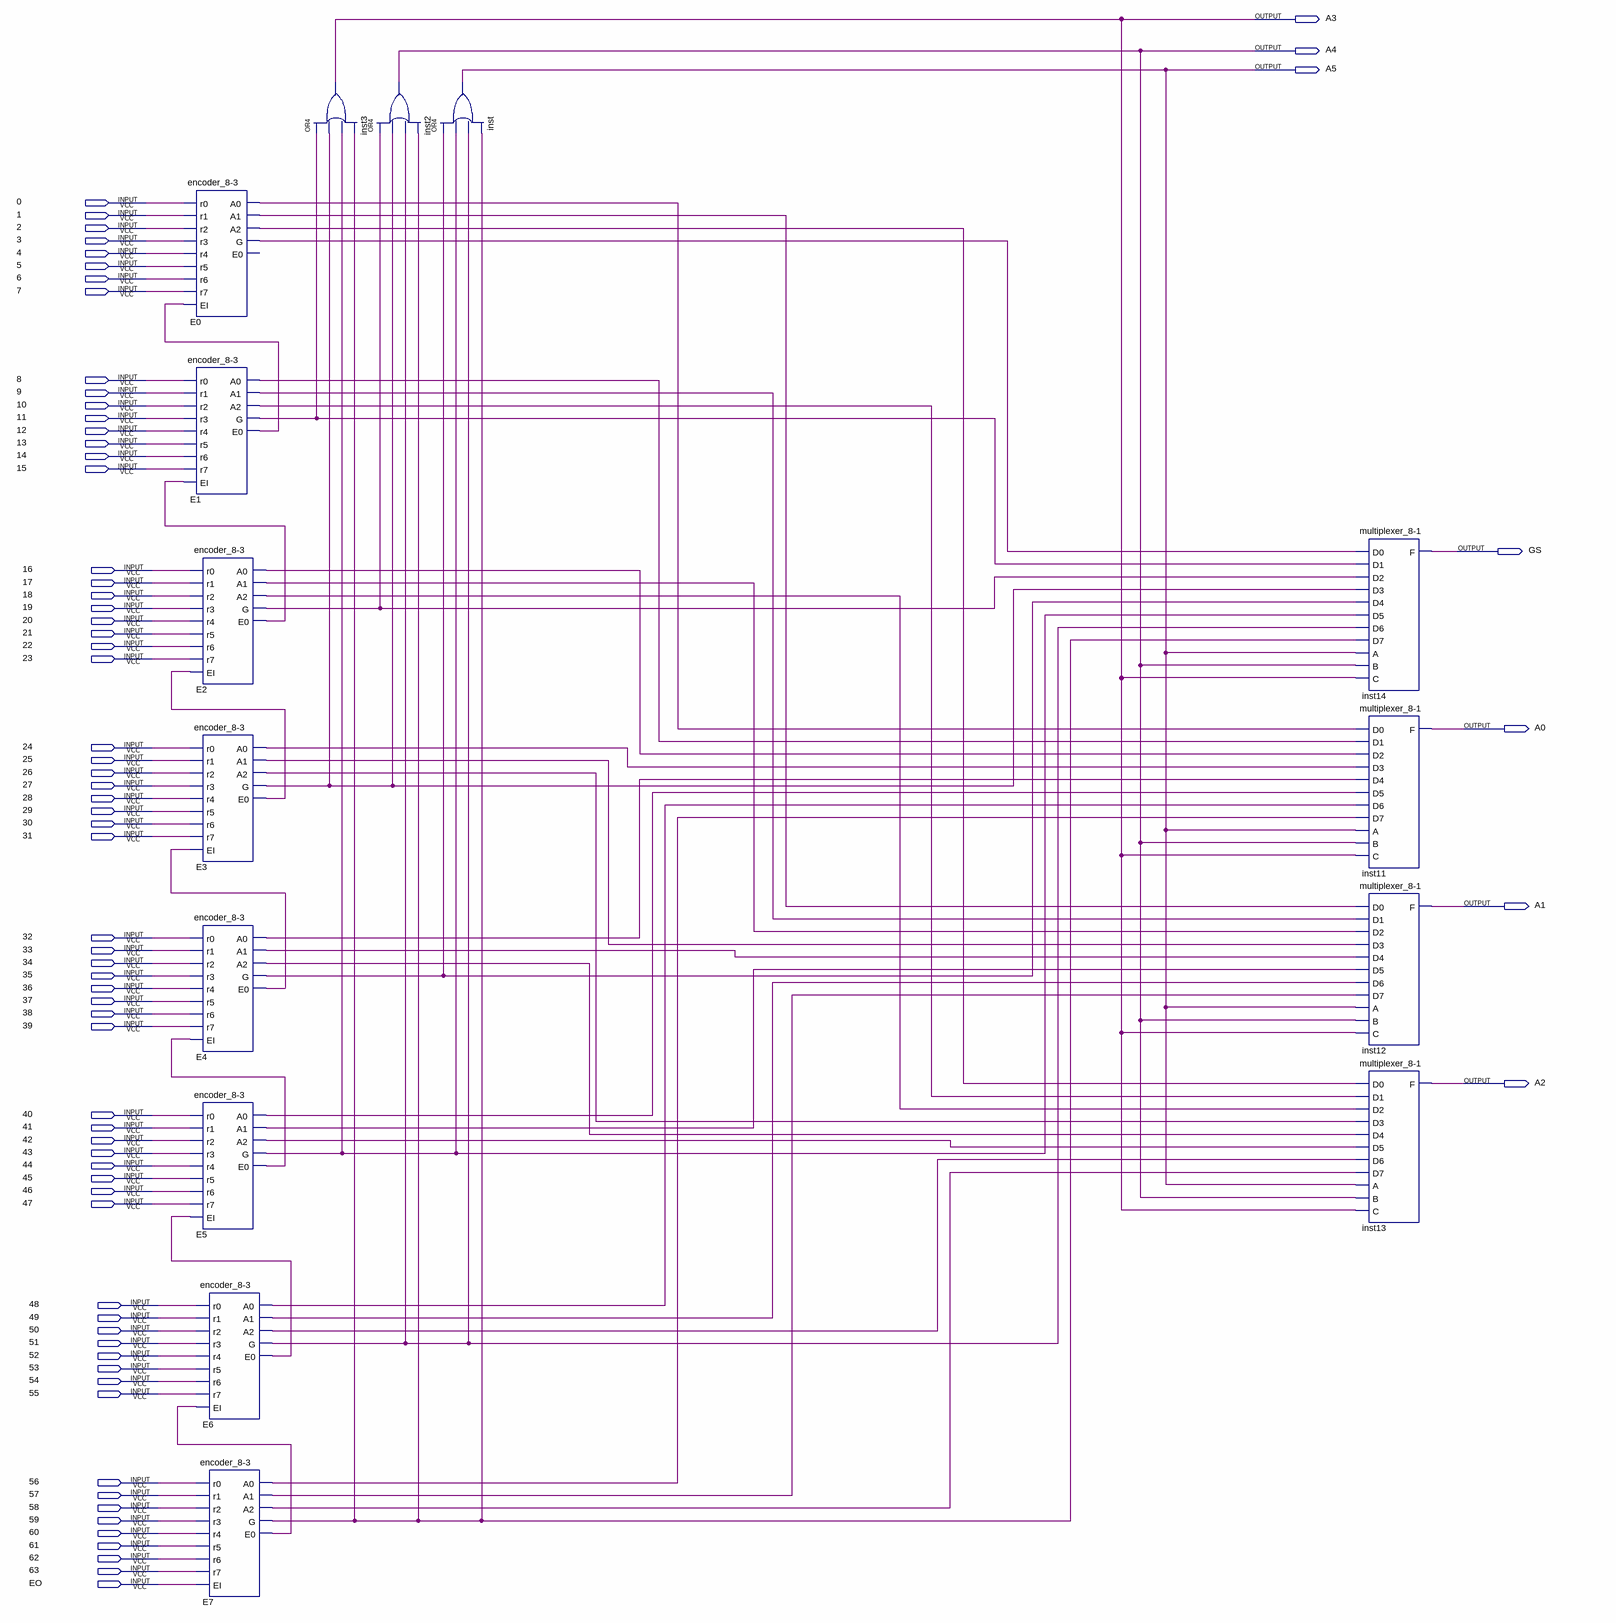
[diagram p0: schematic sheet]
// Quartus schematic encoder_64-6.bdf as structural Verilog: 15 symbols, 72 pins
module \encoder_64-6  (
  input  \0 ,
  input  \1 ,
  input  \2 ,
  input  \3 ,
  input  \4 ,
  input  \5 ,
  input  \6 ,
  input  \7 ,
  input  \8 ,
  input  \9 ,
  input  \10 ,
  input  \11 ,
  input  \12 ,
  input  \13 ,
  input  \14 ,
  input  \15 ,
  input  \16 ,
  input  \17 ,
  input  \18 ,
  input  \19 ,
  input  \20 ,
  input  \21 ,
  input  \22 ,
  input  \23 ,
  input  \24 ,
  input  \25 ,
  input  \26 ,
  input  \27 ,
  input  \28 ,
  input  \29 ,
  input  \30 ,
  input  \31 ,
  input  \32 ,
  input  \33 ,
  input  \34 ,
  input  \35 ,
  input  \36 ,
  input  \37 ,
  input  \38 ,
  input  \39 ,
  input  \40 ,
  input  \41 ,
  input  \42 ,
  input  \43 ,
  input  \44 ,
  input  \45 ,
  input  \46 ,
  input  \47 ,
  input  \48 ,
  input  \49 ,
  input  \50 ,
  input  \51 ,
  input  \52 ,
  input  \53 ,
  input  \54 ,
  input  \55 ,
  input  \56 ,
  input  \57 ,
  input  \58 ,
  input  \59 ,
  input  \60 ,
  input  \61 ,
  input  \62 ,
  input  \63 ,
  input  EO,
  output A3,
  output A4,
  output A5,
  output GS,
  output A0,
  output A1,
  output A2
);

  wire E0_a0, E0_a1, E0_a2, E0_g, E1_a0, E1_a1, E1_a2, E1_e0, E1_g, E2_a0, E2_a1, E2_a2, E2_e0, E2_g, E3_a0,
       E3_a1, E3_a2, E3_e0, E3_g, E4_a0, E4_a1, E4_a2, E4_e0, E4_g, E5_a0, E5_a1, E5_a2, E5_e0, E5_g, E6_a0,
       E6_a1, E6_a2, E6_e0, E6_g, E7_a0, E7_a1, E7_a2, E7_e0, E7_g;

  \encoder_8-3  E0 (
    .r0(\0 ), .r1(\1 ), .r2(\2 ), .r3(\3 ), .r4(\4 ), .r5(\5 ), .r6(\6 ), .r7(\7 ), .EI(E1_e0), .A0(E0_a0),
    .A1(E0_a1), .A2(E0_a2), .G(E0_g));  // open: E0
  \encoder_8-3  E1 (
    .r0(\8 ), .r1(\9 ), .r2(\10 ), .r3(\11 ), .r4(\12 ), .r5(\13 ), .r6(\14 ), .r7(\15 ), .EI(E2_e0),
    .A0(E1_a0), .A1(E1_a1), .A2(E1_a2), .G(E1_g), .E0(E1_e0));
  \encoder_8-3  E2 (
    .r0(\16 ), .r1(\17 ), .r2(\18 ), .r3(\19 ), .r4(\20 ), .r5(\21 ), .r6(\22 ), .r7(\23 ), .EI(E3_e0),
    .A0(E2_a0), .A1(E2_a1), .A2(E2_a2), .G(E2_g), .E0(E2_e0));
  \encoder_8-3  E3 (
    .r0(\24 ), .r1(\25 ), .r2(\26 ), .r3(\27 ), .r4(\28 ), .r5(\29 ), .r6(\30 ), .r7(\31 ), .EI(E4_e0),
    .A0(E3_a0), .A1(E3_a1), .A2(E3_a2), .G(E3_g), .E0(E3_e0));
  \encoder_8-3  E4 (
    .r0(\32 ), .r1(\33 ), .r2(\34 ), .r3(\35 ), .r4(\36 ), .r5(\37 ), .r6(\38 ), .r7(\39 ), .EI(E5_e0),
    .A0(E4_a0), .A1(E4_a1), .A2(E4_a2), .G(E4_g), .E0(E4_e0));
  \encoder_8-3  E5 (
    .r0(\40 ), .r1(\41 ), .r2(\42 ), .r3(\43 ), .r4(\44 ), .r5(\45 ), .r6(\46 ), .r7(\47 ), .EI(E6_e0),
    .A0(E5_a0), .A1(E5_a1), .A2(E5_a2), .G(E5_g), .E0(E5_e0));
  \encoder_8-3  E6 (
    .r0(\48 ), .r1(\49 ), .r2(\50 ), .r3(\51 ), .r4(\52 ), .r5(\53 ), .r6(\54 ), .r7(\55 ), .EI(E7_e0),
    .A0(E6_a0), .A1(E6_a1), .A2(E6_a2), .G(E6_g), .E0(E6_e0));
  \encoder_8-3  E7 (
    .r0(\56 ), .r1(\57 ), .r2(\58 ), .r3(\59 ), .r4(\60 ), .r5(\61 ), .r6(\62 ), .r7(\63 ), .EI(EO),
    .A0(E7_a0), .A1(E7_a1), .A2(E7_a2), .G(E7_g), .E0(E7_e0));
  or inst3 (A3, E1_g, E3_g, E5_g, E7_g);
  or inst2 (A4, E2_g, E3_g, E6_g, E7_g);
  or inst (A5, E4_g, E5_g, E6_g, E7_g);
  \multiplexer_8-1  inst14 (
    .D0(E0_g), .D1(E1_g), .D2(E2_g), .D3(E3_g), .D4(E4_g), .D5(E5_g), .D6(E6_g), .D7(E7_g), .A(A5), .B(A4),
    .C(A3), .F(GS));
  \multiplexer_8-1  inst11 (
    .D0(E0_a0), .D1(E1_a0), .D2(E2_a0), .D3(E3_a0), .D4(E4_a0), .D5(E5_a0), .D6(E6_a0), .D7(E7_a0), .A(A5),
    .B(A4), .C(A3), .F(A0));
  \multiplexer_8-1  inst12 (
    .D0(E0_a1), .D1(E1_a1), .D2(E2_a1), .D3(E3_a1), .D4(E4_a1), .D5(E5_a1), .D6(E6_a1), .D7(E7_a1), .A(A5),
    .B(A4), .C(A3), .F(A1));
  \multiplexer_8-1  inst13 (
    .D0(E0_a2), .D1(E1_a2), .D2(E2_a2), .D3(E3_a2), .D4(E4_a2), .D5(E5_a2), .D6(E6_a2), .D7(E7_a2), .A(A5),
    .B(A4), .C(A3), .F(A2));
endmodule
